# Altium schematic sheet Phase_Current_Voltage_Sense.SchDoc: =DT_SCH_Title
size A3; Organization: Droid Technologies; SheetNumber: 20; SheetTotal: 21
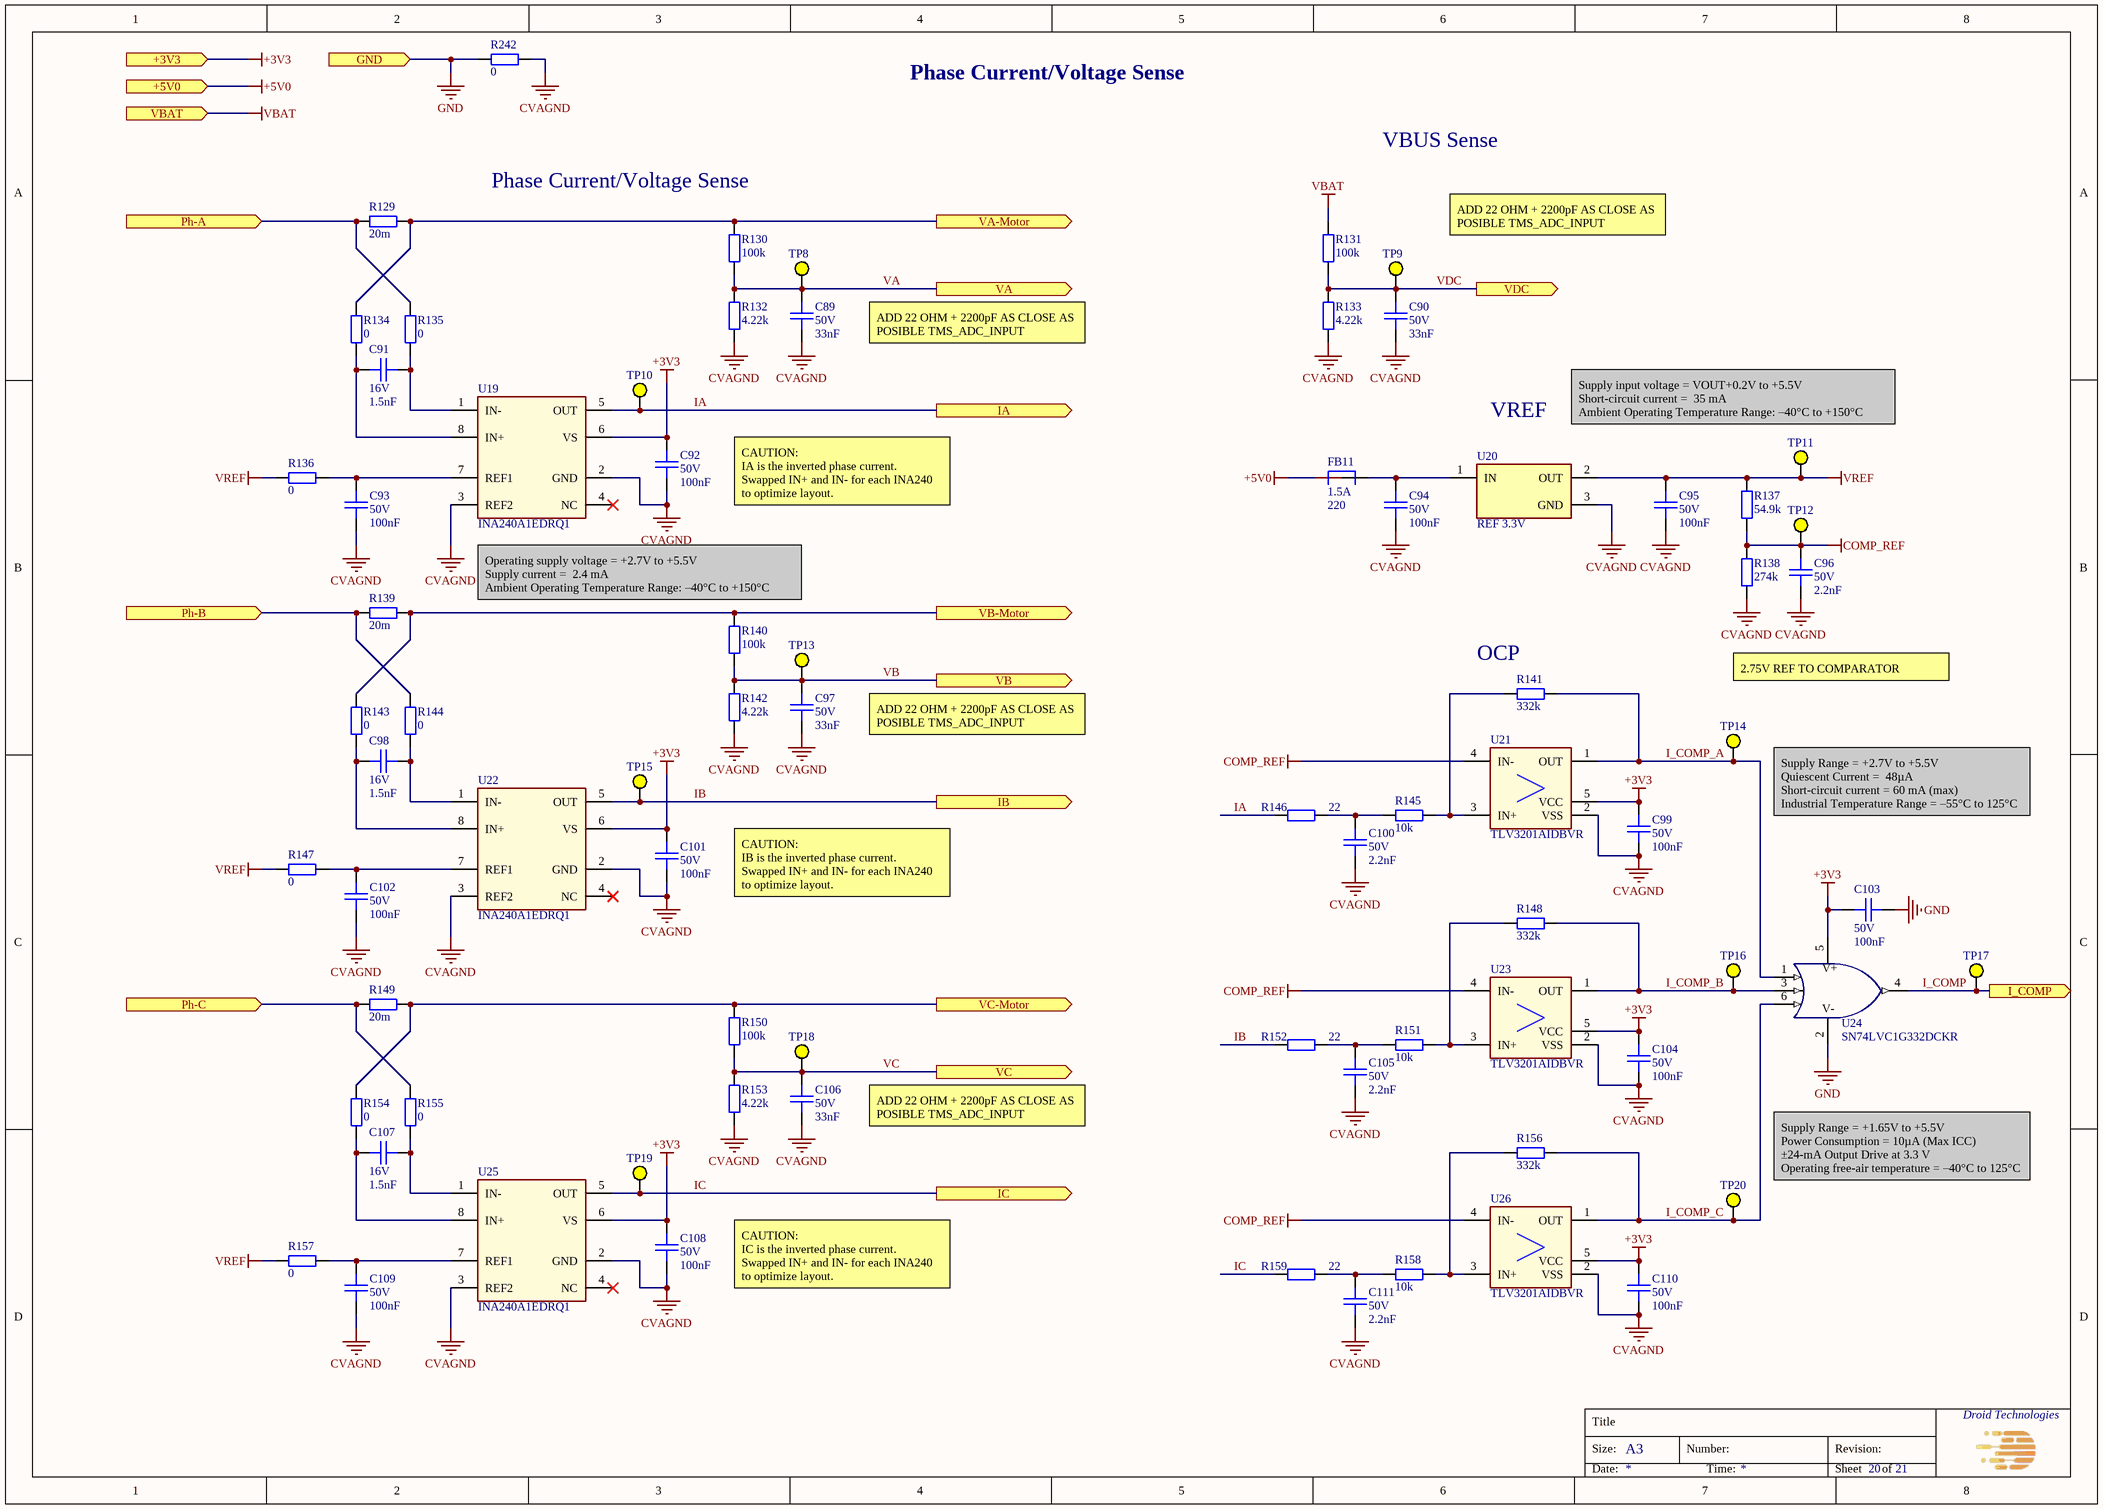
[diagram p0: Phase_Current_Voltage_Sense.SchDoc]

## Parts
C89  Voltage Rating: 50V  Capacitance: 33nF  [CAPC100x50x50L25]  (hidden comment: GCM155L8EH333KE07D)
C90  Voltage Rating: 50V  Capacitance: 33nF  [CAPC100x50x50L25]  (hidden comment: GCM155L8EH333KE07D)
C91  Voltage Rating: 16V  Capacitance: 1.5nF  [CAPC100x50x50L25]  (hidden comment: C0402C152F4HACAUTO)
C92  Voltage Rating: 50V  Capacitance: 100nF  [CAPC100x50x50L25]  (hidden comment: GCM155L8EH104KE07D)
C93  Voltage Rating: 50V  Capacitance: 100nF  [CAPC100x50x50L25]  (hidden comment: GCM155L8EH104KE07D)
C94  Voltage Rating: 50V  Capacitance: 100nF  [CAPC100x50x50L25]  (hidden comment: GCM155L8EH104KE07D)
C95  Voltage Rating: 50V  Capacitance: 100nF  [CAPC100x50x50L25]  (hidden comment: GCM155L8EH104KE07D)
C96  Voltage Rating: 50V  Capacitance: 2.2nF  [CAPC100x50x50L25]  (hidden comment: CGA2B2X8R1H222K050BA)
C97  Voltage Rating: 50V  Capacitance: 33nF  [CAPC100x50x50L25]  (hidden comment: GCM155L8EH333KE07D)
C98  Voltage Rating: 16V  Capacitance: 1.5nF  [CAPC100x50x50L25]  (hidden comment: C0402C152F4HACAUTO)
C99  Voltage Rating: 50V  Capacitance: 100nF  [CAPC100x50x50L25]  (hidden comment: GCM155L8EH104KE07D)
C100  Voltage Rating: 50V  Capacitance: 2.2nF  [CAPC100x50x50L25]  (hidden comment: CGA2B2X8R1H222K050BA)
C101  Voltage Rating: 50V  Capacitance: 100nF  [CAPC100x50x50L25]  (hidden comment: GCM155L8EH104KE07D)
C102  Voltage Rating: 50V  Capacitance: 100nF  [CAPC100x50x50L25]  (hidden comment: GCM155L8EH104KE07D)
C103  Voltage Rating: 50V  Capacitance: 100nF  [CAPC100x50x50L25]  (hidden comment: GCM155L8EH104KE07D)
C104  Voltage Rating: 50V  Capacitance: 100nF  [CAPC100x50x50L25]  (hidden comment: GCM155L8EH104KE07D)
C105  Voltage Rating: 50V  Capacitance: 2.2nF  [CAPC100x50x50L25]  (hidden comment: CGA2B2X8R1H222K050BA)
C106  Voltage Rating: 50V  Capacitance: 33nF  [CAPC100x50x50L25]  (hidden comment: GCM155L8EH333KE07D)
C107  Voltage Rating: 16V  Capacitance: 1.5nF  [CAPC100x50x50L25]  (hidden comment: C0402C152F4HACAUTO)
C108  Voltage Rating: 50V  Capacitance: 100nF  [CAPC100x50x50L25]  (hidden comment: GCM155L8EH104KE07D)
C109  Voltage Rating: 50V  Capacitance: 100nF  [CAPC100x50x50L25]  (hidden comment: GCM155L8EH104KE07D)
C110  Voltage Rating: 50V  Capacitance: 100nF  [CAPC100x50x50L25]  (hidden comment: GCM155L8EH104KE07D)
C111  Voltage Rating: 50V  Capacitance: 2.2nF  [CAPC100x50x50L25]  (hidden comment: CGA2B2X8R1H222K050BA)
FB11  Imax: 1.5A  Impedance: 220  [BEADC160X80X95L40]  (hidden comment: BLM18KG221BH1D)
R129  Resistance: 20m  [RC_CRA2512_Bourns]  (hidden comment: CRA2512-FZ-R020ELF)
R130  Resistance: 100k  [RESC100X50X40L25]  (hidden comment: RC0402FR-07100KL)
R131  Resistance: 100k  [RESC100X50X40L25]  (hidden comment: RC0402FR-07100KL)
R132  Resistance: 4.22k  [RESC100X50X40L25]  (hidden comment: RC0402FR-074K22L)
R133  Resistance: 4.22k  [RESC100X50X40L25]  (hidden comment: RC0402FR-074K22L)
R134  Resistance: 0  [RESC160X80X55L30]  (hidden comment: RC0603FR-070RL)
R135  Resistance: 0  [RESC160X80X55L30]  (hidden comment: RC0603FR-070RL)
R136  Resistance: 0  [RESC160X80X55L30]  (hidden comment: RC0603FR-070RL)
R137  Resistance: 54.9k  [RESC100X50X40L25]  (hidden comment: RC0402FR-0754K9L)
R138  Resistance: 274k  [RESC100X50X40L25]  (hidden comment: RC0402FR-07274KL)
R139  Resistance: 20m  [RC_CRA2512_Bourns]  (hidden comment: CRA2512-FZ-R020ELF)
R140  Resistance: 100k  [RESC100X50X40L25]  (hidden comment: RC0402FR-07100KL)
R141  Resistance: 332k  [RESC100X50X40L25]  (hidden comment: RC0402FR-07332KL)
R142  Resistance: 4.22k  [RESC100X50X40L25]  (hidden comment: RC0402FR-074K22L)
R143  Resistance: 0  [RESC160X80X55L30]  (hidden comment: RC0603FR-070RL)
R144  Resistance: 0  [RESC160X80X55L30]  (hidden comment: RC0603FR-070RL)
R145  Resistance: 10k  [RESC100X50X40L25]  (hidden comment: RC0402FR-0710KL)
R146  Resistance: 22  [RESC100X50X40L25]  (hidden comment: RC0402FR-0722RL)
R147  Resistance: 0  [RESC160X80X55L30]  (hidden comment: RC0603FR-070RL)
R148  Resistance: 332k  [RESC100X50X40L25]  (hidden comment: RC0402FR-07332KL)
R149  Resistance: 20m  [RC_CRA2512_Bourns]  (hidden comment: CRA2512-FZ-R020ELF)
R150  Resistance: 100k  [RESC100X50X40L25]  (hidden comment: RC0402FR-07100KL)
R151  Resistance: 10k  [RESC100X50X40L25]  (hidden comment: RC0402FR-0710KL)
R152  Resistance: 22  [RESC100X50X40L25]  (hidden comment: RC0402FR-0722RL)
R153  Resistance: 4.22k  [RESC100X50X40L25]  (hidden comment: RC0402FR-074K22L)
R154  Resistance: 0  [RESC160X80X55L30]  (hidden comment: RC0603FR-070RL)
R155  Resistance: 0  [RESC160X80X55L30]  (hidden comment: RC0603FR-070RL)
R156  Resistance: 332k  [RESC100X50X40L25]  (hidden comment: RC0402FR-07332KL)
R157  Resistance: 0  [RESC160X80X55L30]  (hidden comment: RC0603FR-070RL)
R158  Resistance: 10k  [RESC100X50X40L25]  (hidden comment: RC0402FR-0710KL)
R159  Resistance: 22  [RESC100X50X40L25]  (hidden comment: RC0402FR-0722RL)
R242  Resistance: 0  [RESC160X80X55L30]  (hidden comment: RC0603FR-070RL)
TP8  Test Point  [TP_D0.75mm]  (value not drawn)
TP9  Test Point  [TP_D0.75mm]  (value not drawn)
TP10  Test Point  [TP_D0.75mm]  (value not drawn)
TP11  Test Point  [TP_D0.75mm]  (value not drawn)
TP12  Test Point  [TP_D0.75mm]  (value not drawn)
TP13  Test Point  [TP_D0.75mm]  (value not drawn)
TP14  Test Point  [TP_D0.75mm]  (value not drawn)
TP15  Test Point  [TP_D0.75mm]  (value not drawn)
TP16  Test Point  [TP_D0.75mm]  (value not drawn)
TP17  Test Point  [TP_D0.75mm]  (value not drawn)
TP18  Test Point  [TP_D0.75mm]  (value not drawn)
TP19  Test Point  [TP_D0.75mm]  (value not drawn)
TP20  Test Point  [TP_D0.75mm]  (value not drawn)
U19  INA240A1EDRQ1  [SOIC8P127_490X600X175L70X41]
U20  REF 3.3V  [SOT-23]
U21  TLV3201AIDBVR  [SOP5P95_290X280X145L45X40]
U22  INA240A1EDRQ1  [SOIC8P127_490X600X175L70X41]
U23  TLV3201AIDBVR  [SOP5P95_290X280X145L45X40]
U24  SN74LVC1G332DCKR  [SC70-6]
U25  INA240A1EDRQ1  [SOIC8P127_490X600X175L70X41]
U26  TLV3201AIDBVR  [SOP5P95_290X280X145L45X40]

## Ports
+3V3 (in), +5V0 (in), GND (in), I_COMP (out), IA (out), IB (out), IC (out), Ph-A (in), Ph-B (in), Ph-C (in), VA (out), VA-Motor (out), VB (out), VB-Motor (out), VBAT (in), VC (out), VC-Motor (out), VDC (out)

## Nets
+3V3: C92.2 C99.2 C101.2 C103.2 C104.2 C108.2 C110.2 U19.6(VS) U21.5(VCC) U22.6(VS) U23.5(VCC) U24.5(VCC) U25.6(VS) U26.5(VCC) ; port +3V3
+5V0: FB11.1 ; port +5V0
COMP_REF: C96.2 R137.1 R138.2 TP12.1 U21.4(IN-) U23.4(IN-) U26.4(IN-)
CVAGND: C89.1 C90.1 C92.1 C93.1 C94.1 C95.1 C96.1 C97.1 C99.1 C100.1 C101.1 C102.1 C104.1 C105.1 C106.1 C108.1 C109.1 C110.1 C111.1 R132.1 R133.1 R138.1 R142.1 R153.1 R242.1 U19.2(GND) U19.3(REF2) U20.3(GND) U21.2(VSS) U22.2(GND) U22.3(REF2) U23.2(VSS) U25.2(GND) U25.3(REF2) U26.2(VSS)
GND: C103.1 R242.2 U24.2(GND) ; port GND
VBAT: R131.2 ; port VBAT
VREF: C95.2 R136.1 R137.2 R147.1 R157.1 TP11.1 U20.2(OUT)
I_COMP: TP17.1 U24.4(Y) ; port I_COMP
I_COMP_A: R141.2 TP14.1 U21.1(OUT) U24.1(A)
I_COMP_B: R148.2 TP16.1 U23.1(OUT) U24.3(B)
I_COMP_C: R156.2 TP20.1 U24.6(C) U26.1(OUT)
IA: R146.1 TP10.1 U19.5(OUT) ; port IA
IB: R152.1 TP15.1 U22.5(OUT) ; port IB
IC: R159.1 TP19.1 U25.5(OUT) ; port IC
Ph-A: R129.1 R135.2 ; port Ph-A
Ph-B: R139.1 R144.2 ; port Ph-B
Ph-C: R149.1 R155.2 ; port Ph-C
VA: C89.2 R130.1 R132.2 TP8.1 ; port VA
VA-Motor: R129.2 R130.2 R134.2 ; port VA-Motor
VB: C97.2 R140.1 R142.2 TP13.1 ; port VB
VB-Motor: R139.2 R140.2 R143.2 ; port VB-Motor
VC: C106.2 R150.1 R153.2 TP18.1 ; port VC
VC-Motor: R149.2 R150.2 R154.2 ; port VC-Motor
VDC: C90.2 R131.1 R133.2 TP9.1 ; port VDC
NetC91_1: C91.1 R135.1 U19.1(IN-)
NetC91_2: C91.2 R134.1 U19.8(IN+)
NetC93_2: C93.2 R136.2 U19.7(REF1)
NetC94_2: C94.2 FB11.2 U20.1(IN)
NetC98_1: C98.1 R144.1 U22.1(IN-)
NetC98_2: C98.2 R143.1 U22.8(IN+)
NetC100_2: C100.2 R145.1 R146.2
NetC102_2: C102.2 R147.2 U22.7(REF1)
NetC105_2: C105.2 R151.1 R152.2
NetC107_1: C107.1 R155.1 U25.1(IN-)
NetC107_2: C107.2 R154.1 U25.8(IN+)
NetC109_2: C109.2 R157.2 U25.7(REF1)
NetC111_2: C111.2 R158.1 R159.2
NetR141_1: R141.1 R145.2 U21.3(IN+)
NetR148_1: R148.1 R151.2 U23.3(IN+)
NetR156_1: R156.1 R158.2 U26.3(IN+)

Not connected (* = marked no-connect by the designer): U19 4(NC)*; U22 4(NC)*; U25 4(NC)*

## Notes on the sheet
- Phase Current/Voltage Sense
- VBUS Sense
- (near R130) Phase Current/Voltage Sense
- ADD 22 OHM + 2200pF AS CLOSE AS POSIBLE TMS_ADC_INPUT
- VREF
- Supply input voltage = VOUT+0.2V to +5.5V
  Short-circuit current =  35 mA
  Ambient Operating Temperature Range: –40°C to +150°C
- CAUTION:
  IA is the inverted phase current.
  Swapped IN+ and IN- for each INA240 to optimize layout.
- Operating supply voltage = +2.7V to +5.5V
  Supply current =  2.4 mA
  Ambient Operating Temperature Range: –40°C to +150°C
- (near R141) OCP
- 2.75V REF TO COMPARATOR
- (near TP14) Supply Range = +2.7V to +5.5V
  Quiescent Current =  48µA
  Short-circuit current = 60 mA (max)
  Industrial Temperature Range = –55°C to 125°C
- CAUTION:
  IB is the inverted phase current.
  Swapped IN+ and IN- for each INA240 to optimize layout.
- (near TP20) Supply Range = +1.65V to +5.5V
  Power Consumption = 10µA (Max ICC)
  ±24-mA Output Drive at 3.3 V
  Operating free-air temperature = –40°C to 125°C
- CAUTION:
  IC is the inverted phase current.
  Swapped IN+ and IN- for each INA240 to optimize layout.
- Title
- Size:
- A3
- Number:
- Revision:
- Date:
- Time:
- Sheet
- of
- (in symbol SN74LVC1G332DCKR) V+; V-

## Library data of the parts
C89 C90 C97 C106 = CMP-001-2007-2: CAP CER 0.033UF 50V X8L 0402; Manufacturer: Murata Electronics; Op Temp max: 150°C; Tolerance: 10%; Op Temp min: -55°C; ComponentLink1URL: https://www.murata.com/en-us/products/productdetail?partno=GCM155L8EH333KE07%23; Mounting Type: SM; Dielectric: X8L; ComponentLink3URL: https://www.digikey.com/en/products/detail/murata-electronics/GCM155L8EH333KE07D/17845188; Size: 1.00mm x 0.50mm; ComponentLink1Description: Datasheet; ComponentLink3Description: Digikey; Package: 0402 (1005 Metric); MPN: GCM155L8EH333KE07D; ComponentLink2Description: Mouser; Height max: 550µm; Lead Spacing: 0mm; ComponentLink2URL: https://eu.mouser.com/ProductDetail/Murata-Electronics/GCM155L8EH333KE07D?qs=rrS6PyfT74cZK6FfR7MiFw%3D%3D; Ratings: AEC-Q200
C91 C98 C107 = CMP-001-2006-2: CAP CER 0402 1.5NF 16V ULTRA STA; Manufacturer: KEMET; Op Temp min: -55°C; Op Temp max: 150°C; Dielectric: X8R; Tolerance: 1%; Ratings: AEC-Q200; Lead Spacing: 0mm; Package: 0402 (1005 Metric); Size: 1.00mm x 0.50mm; ComponentLink3URL: https://www.digikey.com/en/products/detail/kemet/C0402C152F4HACAUTO/7955197?s=N4IgjCBcpgLFoDGUBmBDANgZwKYBoQB7KAbXAAYAOAdlgCYQBdAgBwBcoQBlNgJwEsAdgHMQAXwJgAbAhDJI6bPiKkQAZgCcYAKyUmrDpG58hoiSDraG0Oaky4CxSGTr0NaiMxDtOPASPECanJqWXlFBxVndTA6MHJtfW9DY38zSQ1KDTC7JUdVciZzOnJYbJtw%2B2UnMh1ycgACFgAxJJ8jAFVBfjYAeRQAWRw0LABXXhxAkABaayQoPlHq1UTGMWLVOvIWFCKgA; ComponentLink2Description: Mouser; ComponentLink3Description: Digikey; ComponentLink1URL: https://www.kemet.com/en/us/product/C0402C152F4HACAUTO.html; Mounting Type: SM; MPN: C0402C152F4HACAUTO; Height max: 550µm; ComponentLink1Description: Datasheet; ComponentLink2URL: https://eu.mouser.com/ProductDetail/KEMET/C0402C152F4HACAUTO?qs=j%252B1pi9TdxUbEW1hCqLU6QA%3D%3D
C92-C95 C99 C101-C104 C108-C110 = CMP-001-1980-2: CAP CER 0.1UF 50V X8L 0402; Manufacturer: Murata Electronics; Op Temp max: 150°C; Op Temp min: -55°C; Tolerance: 10%; Height max: 550µm; ComponentLink3Description: Digikey; Mounting Type: SM; ComponentLink3URL: https://www.digikey.com/en/products/detail/murata-electronics/GCM155L8EH104KE07D/11618823; Package: 0402 (1005 Metric); Lead Spacing: 0mm; MPN: GCM155L8EH104KE07D; Size: 1.00mm x 0.50mm; Ratings: AEC-Q200; ComponentLink1URL: https://www.murata.com/en-us/products/productdetail?partno=GCM155L8EH104KE07%23; ComponentLink1Description: Datasheet; Dielectric: X8L; ComponentLink2Description: Mouser; ComponentLink2URL: https://eu.mouser.com/ProductDetail/Murata-Electronics/GCM155L8EH104KE07D?qs=1mbolxNpo8fQSHf0HYnZWw%3D%3D
C96 C100 C105 C111 = CMP-001-2008-2: CAP CER 2200PF 50V X8R 0402; Manufacturer: TDK Corporation; Op Temp max: 150°C; Op Temp min: -55°C; Tolerance: 10%; Size: 1.00mm x 0.50mm; ComponentLink1URL: https://product.tdk.com/en/search/capacitor/ceramic/mlcc/info?part_no=CGA2B2X8R1H222K050BA; ComponentLink3Description: Digikey; Mounting Type: SM; Ratings: AEC-Q200; ComponentLink3URL: https://www.digikey.com/en/products/detail/tdk-corporation/CGA2B2X8R1H222K050BA/2443359; Dielectric: X8R; ComponentLink2URL: https://eu.mouser.com/ProductDetail/TDK/CGA2B2X8R1H222K050BA?qs=NRhsANhppD9e0pyGSMWEuA%3D%3D; Height max: 550µm; ComponentLink1Description: Datasheet; Package: 0402 (1005 Metric); ComponentLink2Description: Mouser; MPN: CGA2B2X8R1H222K050BA; Lead Spacing: 0mm
FB11 = CMP-001-1981-1: FERRITE BEAD 220 OHM 0603 1LN; Manufacturer: Murata Electronics; DCR: 50m; Op Temp min: -55°C; Frequency: 100MHz; Op Temp max: 150°C; Number of Lines: 1; Mounting Type: SM; Size: 1.60mm x 0.80mm; ComponentLink2URL: https://eu.mouser.com/ProductDetail/Murata-Electronics/BLM18KG221BH1D?qs=sJ5gq5MLFXpgEHYBdWUtkQ%3D%3D; ComponentLink1Description: Datasheet; ComponentLink1URL: https://www.murata.com/en-us/products/productdata/8798137286686/QNFA9129.pdf; Lead Spacing: 0mm; Ratings: AEC-Q200; ComponentLink3Description: Digikey; ComponentLink3URL: https://www.digikey.com/en/products/detail/murata-electronics/BLM18KG221BH1D/6156000; Height max: 950µm; Package: 0603 (1608 Metric); ComponentLink2Description: Mouser; MPN: BLM18KG221BH1D
R129 R139 R149 = RC_CRA2512-FZ-R020ELF: RES 0.02 OHM 1% 3W 2512; Manufacturer: Bourns Inc.; Temperature Coefficient: ±50ppm/°C; Op Temp min: -55°C; Op Temp max: 170°C; Ratings: Automotive AEC-Q200; Package: 2512 (6332 Metric); MPN: CRA2512-FZ-R020ELF; Size: 6.45mm x 3.35mm; ComponentLink1Description: Datasheet; Power: 3W; ComponentLink3Description: Digikey; ComponentLink2URL: https://eu.mouser.com/ProductDetail/Bourns/CRA2512-FZ-R020ELF?qs=WqWCsLCZBkqBWIN8p659hA%3D%3D; Mounting Type: SM; Composition: Metal Element; ComponentLink3URL: https://www.digikey.com/en/products/detail/bourns-inc/CRA2512-FZ-R020ELF/1775030; Tolerance: ±1%; Height max: 0.90mm; ComponentLink2Description: Mouser; ComponentLink1URL: https://www.bourns.com/docs/product-datasheets/cra.pdf; Component Type: Chip Resistor
R130 R131 R140 R150 = CMP-00121-6: RES 100K OHM 1% 1/16W 0402; Manufacturer: YAGEO; Op Temp min: -55°C; Op Temp max: 155°C; Power: 63mW; Temperature Coefficient: ±100ppm; ComponentLink2Description: Mouser; Mounting Type: SM; Composition: Thick Film; ComponentLink3URL: https://www.digikey.com/en/products/detail/yageo/RC0402FR-07100KL/726526; Size: 1.00mm x 0.50mm; MPN: RC0402FR-07100KL; Tolerance: 1%; Ratings: -; ComponentLink1Description: Datasheet; ComponentLink2URL: https://eu.mouser.com/ProductDetail/YAGEO/RC0402FR-07100KL?qs=%2Fha2pyFaduhjtLcYvKXQ8IUndG0u%252BuCx1gxMxvN%252Btd7iB7mgHWsSbw%3D%3D; Package: 0402 (1005 Metric); ComponentLink1URL: https://www.yageo.com/upload/media/product/productsearch/datasheet/rchip/PYu-RC_Group_51_RoHS_L_12.pdf; ComponentLink3Description: Digikey; Height max: 400µm
R132 R133 R142 R153 = CMP-00686-2: RES 4.22K OHM 1% 1/16W 0402; Manufacturer: YAGEO; Temperature Coefficient: ±100ppm; Op Temp max: 155°C; Op Temp min: -55°C; Power: 63mW; Height max: 400µm; Tolerance: 1%; Mounting Type: SM; ComponentLink2URL: https://eu.mouser.com/ProductDetail/YAGEO/RC0402FR-074K22L?qs=UOUeRUa%252B8WlIkeLfnYGqDQ%3D%3D; ComponentLink3URL: https://www.digikey.com/en/products/detail/yageo/RC0402FR-074K22L/5281032?s=N4IgTCBcDaIEoGEAMAWJYBicC0SDsKA0mGADIgC6AvkA; ComponentLink2Description: Mouser; Package: 0402 (1005 Metric); ComponentLink3Description: Digikey; MPN: RC0402FR-074K22L; Ratings: -; ComponentLink1Description: Datasheet; ComponentLink1URL: https://www.yageo.com/upload/media/product/productsearch/datasheet/rchip/PYu-RC_Group_51_RoHS_L_12.pdf; Composition: Thick Film; Size: 1.00mm x 0.50mm
R134-R136 R143 R144 R147 R154 R155 R157 R242 = CMP-001-0927-2: RES 0 OHM JUMPER 1/10W 0603; Manufacturer: YAGEO; Op Temp min: -55°C; Op Temp max: 155°C; Power: 100mW; Tolerance: 0%; Height max: 550µm; ComponentLink2URL: https://eu.mouser.com/ProductDetail/YAGEO/RC0603FR-070RL?qs=0yPvnVz5%2FmpDQv43TwvCfw%3D%3D; Temperature Coefficient: -; ComponentLink3Description: Digikey; ComponentLink2Description: Mouser; MPN: RC0603FR-070RL; ComponentLink1URL: https://www.yageo.com/upload/media/product/productsearch/datasheet/rchip/PYu-RC_Group_51_RoHS_L_12.pdf; Ratings: -; Size: 1.60mm x 0.80mm; Composition: Thick Film; Mounting Type: SM; ComponentLink3URL: https://www.digikey.com/en/products/detail/yageo/RC0603FR-070RL/1304008; Package: 0603 (1608 Metric); ComponentLink1Description: Datasheet
R137 = CMP-001-1595-1: RES 54.9K OHM 1% 1/16W 0402; Manufacturer: YAGEO; Op Temp max: 155°C; Power: 63mW; Op Temp min: -55°C; Temperature Coefficient: ±100ppm; Size: 1.00mm x 0.50mm; Composition: Thick Film; Ratings: -; ComponentLink1Description: Datasheet; Tolerance: 1%; ComponentLink2URL: https://eu.mouser.com/ProductDetail/YAGEO/RC0402FR-0754K9L?qs=4PGqJHn8QVJggq6NOjvQiQ%3D%3D; Package: 0402 (1005 Metric); ComponentLink3URL: https://www.digikey.com/en/products/detail/yageo/RC0402FR-0754K9L/5281045; Mounting Type: SM; MPN: RC0402FR-0754K9L; ComponentLink3Description: Digikey; ComponentLink2Description: Mouser; Height max: 400µm; ComponentLink1URL: https://www.yageo.com/upload/media/product/products/datasheet/rchip/PYu-RC_Group_51_RoHS_L_12.pdf
R138 = CMP-00590-3: RES 274K OHM 1% 1/16W 0402; Manufacturer: YAGEO; Op Temp min: -55°C; Op Temp max: 155°C; Temperature Coefficient: ±100ppm; Power: 63mW; MPN: RC0402FR-07274KL; ComponentLink3Description: Digikey; Ratings: -; ComponentLink2Description: Mouser; ComponentLink1URL: https://www.yageo.com/upload/media/product/productsearch/datasheet/rchip/PYu-RC_Group_51_RoHS_L_12.pdf; Size: 1.00mm x 0.50mm; ComponentLink1Description: Datasheet; Tolerance: 1%; Height max: 400µm; Package: 0402 (1005 Metric); Composition: Thick Film; ComponentLink3URL: https://www.digikey.com/en/products/detail/yageo/RC0402FR-07274KL/5280943?s=N4IgTCBcDaIEoGEAMAWJYBicC0SDsYeKA0gDIgC6AvkA; Mounting Type: SM; ComponentLink2URL: https://eu.mouser.com/ProductDetail/YAGEO/RC0402FR-07274KL?qs=UOUeRUa%252B8WkXvujgT9w63w%3D%3D
R141 R148 R156 = CMP-00670-2: RES 332K OHM 1% 1/16W 0402; Manufacturer: YAGEO; Op Temp max: 155°C; Temperature Coefficient: ±100ppm; Power: 63mW; Op Temp min: -55°C; Size: 1.00mm x 0.50mm; ComponentLink1Description: Datasheet; Composition: Thick Film; Package: 0402 (1005 Metric); Height max: 400µm; Ratings: -; ComponentLink2Description: Mouser; ComponentLink3Description: Digikey; MPN: RC0402FR-07332KL; ComponentLink1URL: https://www.yageo.com/upload/media/product/productsearch/datasheet/rchip/PYu-RC_Group_51_RoHS_L_12.pdf; ComponentLink2URL: https://eu.mouser.com/ProductDetail/YAGEO/RC0402FR-07332KL?qs=5YWhraou11DzMN0bHRRHtQ%3D%3D; ComponentLink3URL: https://www.digikey.com/en/products/detail/yageo/RC0402FR-07332KL/726595?s=N4IgTCBcDaIEoGEAMAWJYBicC0SDsAzAWANIAyIAugL5A; Mounting Type: SM; Tolerance: 1%
R145 R151 R158 = CMP-00010-6: RES 10K OHM 1% 1/16W 0402; Manufacturer: YAGEO; Op Temp max: 155°C; Op Temp min: -55°C; Power: 63mW; Temperature Coefficient: ±100ppm; ComponentLink3URL: https://www.digikey.com/en/products/detail/yageo/RC0402FR-0710KL/726523; ComponentLink1Description: Datasheet; Height max: 400µm; ComponentLink3Description: Digikey; ComponentLink2URL: https://www2.mouser.com/ProductDetail/YAGEO/RC0402FR-0710KL?qs=%2Fha2pyFaduhjtLcYvKXQ8NAGbRXkQ%2Fwl6RsvWHeV66MSeqLhkcF3rg%3D%3D; Ratings: -; MPN: RC0402FR-0710KL; ComponentLink1URL: https://www.yageo.com/upload/media/product/productsearch/datasheet/rchip/PYu-RC_Group_51_RoHS_L_12.pdf; ComponentLink2Description: Mouser; Mounting Type: SM; Tolerance: 1%; Composition: Thick Film; Size: 1.00mm x 0.50mm; Package: 0402 (1005 Metric)
R146 R152 R159 = CMP-001-0482-4: RES 22 OHM 1% 1/16W 0402; Manufacturer: YAGEO; Temperature Coefficient: ±100ppm; Op Temp max: 155°C; Op Temp min: -55°C; Power: 63mW; Ratings: -; ComponentLink3URL: https://www.digikey.com/en/products/detail/yageo/RC0402FR-0722RL/726562; ComponentLink2URL: https://eu.mouser.com/ProductDetail/YAGEO/RC0402FR-0722RL?qs=V1yeUXFNrkkRg6zf08ADKQ%3D%3D; MPN: RC0402FR-0722RL; ComponentLink1Description: Datasheet; ComponentLink3Description: Digikey; Tolerance: 1%; Size: 1.00mm x 0.50mm; ComponentLink1URL: https://www.yageo.com/upload/media/product/productsearch/datasheet/rchip/PYu-RC_Group_51_RoHS_L_12.pdf; Composition: Thick Film; ComponentLink2Description: Mouser; Mounting Type: SM; Package: 0402 (1005 Metric); Height max: 400µm
TP8-TP20 = TP_0.75: Test point 0.75mm
U19 U22 U25 = INA240A1EDRQ1: IC CURRENT SENSE 1 CIRCUIT 8SOIC; Manufacturer: Texas Instruments; MPN: INA240A1EDRQ1
U20 = REF3333AIDBZR: IC VREF SERIES 0.15% SOT23-3; Manufacturer: Texas Instruments; MPN: REF3333AIDBZR
U21 U23 U26 = CMP-001-2009-1: IC COMPARATOR 1 GEN PUR SOT23-5; Manufacturer: Texas Instruments; Op Temp max: 125°C; Current - Quiescent (Max): 40µA; Output Type: Push-Pull; Propagation Delay (Max): 50ns; Number of Elements: 1; Op Temp min: -40°C; Hysteresis: 1.2mV; Current - Input Bias (Max): 0.005µA @ 5V; Voltage - Input Offset (Max): 1mV @ 5V; CMRR, PSRR (Typ): 70dB CMRR, 85dB PSRR; Current - Output (Typ): 21mA; Voltage - Supply, Single/Dual (±): 2.7V ~ 5.5V; ComponentLink1Description: Datasheet; ComponentLink1URL: https://www.ti.com/lit/ds/symlink/tlv3201.pdf?HQS=dis-dk-null-digikeymode-dsf-pf-null-wwe&ts=1745660417910&ref_url=https%253A%252F%252Fwww.ti.com%252Fgeneral%252Fdocs%252Fsuppproductinfo.tsp%253FdistId%253D10%2526gotoUrl%253Dhttps%253A%252F%252Fwww.ti.com%252Flit%252Fgpn%252Ftlv3201; ComponentLink2Description: Mouser; Mounting Type: SM; ComponentLink3URL: https://www.digikey.com/en/products/detail/texas-instruments/TLV3201AIDBVR/3188691?s=N4IgTCBcDaICoBkBqBmMAGAjAQQJIBEAhJAJRAF0BfIA; ComponentLink2URL: https://eu.mouser.com/ProductDetail/Texas-Instruments/TLV3201AIDBVR?qs=5771e39Rz9GGuYwPEKy7fA%3D%3D; ComponentLink3Description: Digikey; Package: SC-74A, SOT-753; Ratings: -; MPN: TLV3201AIDBVR
U24 = SN74LVC1G332DCKR: IC GATE OR 1CH 3-INP SC70-6; Manufacturer: Texas Instruments; MPN: SN74LVC1G332DCKR